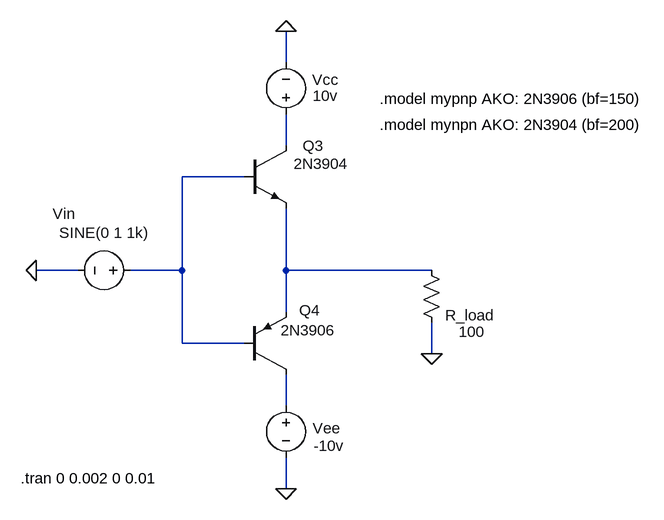
[diagram p0: schematic 4_spice.asc]
4_spice.asc, the LTspice schematic file:
Version 4
SHEET 1 1224 680
WIRE 272 -128 272 -176
WIRE 272 0 272 -48
WIRE 208 48 112 48
WIRE -48 192 -112 192
WIRE 112 192 112 48
WIRE 112 192 32 192
WIRE 272 192 272 96
WIRE 496 192 272 192
WIRE 272 256 272 192
WIRE 112 304 112 192
WIRE 208 304 112 304
WIRE 496 320 496 272
WIRE 272 400 272 352
WIRE 272 528 272 480
FLAG 496 320 0
FLAG 272 528 0
FLAG 272 -176 0
FLAG -112 192 0
SYMBOL npn 208 0 R0
WINDOW 0 90 0 Left 2
WINDOW 3 76 28 Left 2
SYMATTR InstName Q3
SYMATTR Value 2N3904
SYMBOL pnp 208 352 M180
WINDOW 0 84 99 Left 2
SYMATTR InstName Q4
SYMATTR Value 2N3906
SYMBOL res 480 176 R0
WINDOW 0 37 85 Left 2
WINDOW 3 58 110 Left 2
SYMATTR InstName R_load
SYMATTR Value 100
SYMBOL voltage 272 384 R0
WINDOW 0 41 51 Left 2
WINDOW 3 43 78 Left 2
SYMATTR InstName Vee
SYMATTR Value -10v
SYMBOL voltage 272 -32 R180
WINDOW 0 -80 69 Left 2
WINDOW 3 -80 45 Left 2
SYMATTR InstName Vcc
SYMATTR Value 10v
SYMBOL voltage 48 192 R90
WINDOW 123 24 44 Left 2
WINDOW 39 0 0 Left 0
WINDOW 3 -58 -13 VRight 2
WINDOW 0 -87 100 VRight 2
SYMATTR Value SINE(0 1 1k)
SYMATTR InstName Vin
TEXT 416 -72 Left 2 !.model mypnp AKO: 2N3906 (bf=150)
TEXT 416 -32 Left 2 !.model mynpn AKO: 2N3904 (bf=200)
TEXT -136 512 Left 2 !.tran 0 0.002 0 0.01

The netlist it stands for:
* 4_spice.asc
Q3 N001 N002 N003 0 2N3904
Q4 N004 N002 N003 0 2N3906
R_load N003 0 100
Vee N004 0 -10v
Vcc N001 0 10v
Vin N002 0 SINE(0 1 1k)
.model NPN NPN
.model PNP PNP
.lib standard.bjt
.model mypnp AKO: 2N3906 (bf=150)
.model mynpn AKO: 2N3904 (bf=200)
.tran 0 0.002 0 0.01
.backanno
.end